# EAGLE design 4kfcn v1 (EAGLE 9.3.1)
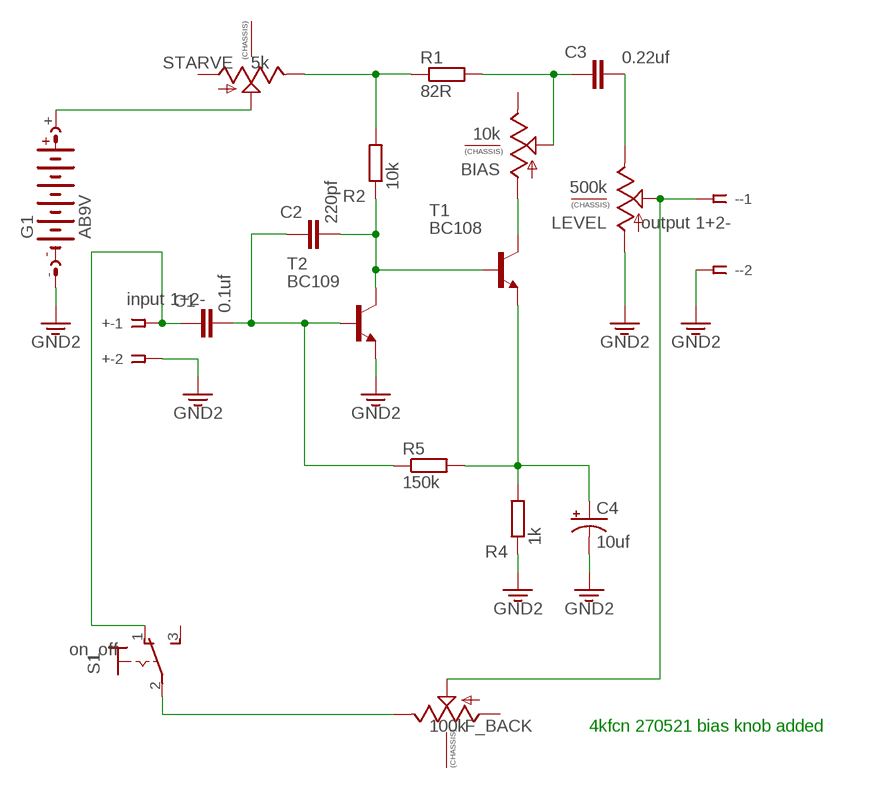
[diagram p0: schematic, sheet 1]

## Parts
+  input 1+2-  SSW-101-02-G-Q  [SSW-101-02-G-Q]
-  output 1+2-  SSW-101-02-G-Q  [SSW-101-02-G-Q]
BIAS  10k  9MM_SNAP-IN_POT_CHASSIS  [9MM_SNAP-IN_POT]
C1  0.1uf  C5/3.5  [C5B3.5]
C2  220pf  C5/3.5  [C5B3.5]
C3  0.22uf  C5/3.5  [C5B3.5]
C4  10uf  1000UF-RADIAL-5MM-25V-20%  [CPOL-RADIAL-5MM-10MM]
F_BACK  100k  9MM_SNAP-IN_POT_CHASSIS  [9MM_SNAP-IN_POT]
G1  AB9V  [AB9V]
LEVEL  500k  9MM_SNAP-IN_POT_CHASSIS  [9MM_SNAP-IN_POT]
R1  82R  R-EU_0207/10  [0207/10]
R2  10k  R-EU_0207/10  [0207/10]
R4  1k  R-EU_0207/10  [0207/10]
R5  150k  R-EU_0207/10  [0207/10]
S1  on_off  M9040P  [M9040P]
STARVE  5k  9MM_SNAP-IN_POT_CHASSIS  [9MM_SNAP-IN_POT]
T1  BC108  BC108B-NPN-TO18-EBC  [TO18]
T2  BC109  BC108B-NPN-TO18-EBC  [TO18]

## Nets
3.3V: +.2 -.2 C4.- G1.- LEVEL.1(A) R4.1 T2.1(E) ; supply symbol labelled GND2
N$1: C2.2 R2.1 T1.2(B) T2.3(C)
N$2: BIAS.1(A) T1.3(C)
N$3: C4.+ R4.2 R5.2 T1.1(E)
N$4: C1.2 C2.1 R5.1 T2.2(B)
N$5: BIAS.2(S) C3.1 R1.2
N$6: R1.1 R2.2 STARVE.3(E)
N$7: +.1 C1.1 S1.1(O)
N$8: C3.2 LEVEL.3(E)
N$9: -.1 F_BACK.2(S) LEVEL.2(S)
N$10: G1.+ STARVE.2(S)
N$11: F_BACK.3(E) S1.2(P)
Unconnected: BIAS.3(E) BIAS.CHASSIS1 BIAS.CHASSIS2 F_BACK.1(A) F_BACK.CHASSIS1 F_BACK.CHASSIS2 LEVEL.CHASSIS1 LEVEL.CHASSIS2 S1.3(S) STARVE.1(A) STARVE.CHASSIS1 STARVE.CHASSIS2

## Notes on the sheet
- 4kfcn 270521 bias knob added

## Library data of the parts
+ - = con-samtec:SSW-101-02-G: THROUGH-HOLE .025" SQ POST SOCKET Source: Samtec SSW.pdf; MF: Samtec Inc.; MPN: SSW-101-02-G-Q
BIAS F_BACK LEVEL STARVE = MusicThingModular:9MM_SNAP-IN_POT_CHASSIS: 9mm vertical snap-in pot, Alpha / Panasonic style, with a connection to the metal chassis for grounding
C1-C3 = capacitor-wima:C: CAPACITOR naming: grid - package width
C4 = SparkFun-Capacitors:1000UF: 1,000µF/1mF ceramic capacitors A capacitor is a passive two-terminal electrical component used to store electrical energy temporarily in an electric field. CAP-08070; PROD_ID: CAP-09538; VALUE: 1mF
G1 = battery:AB9V: 9-V BATTERY CLIP
R1 R2 R4 R5 = resistor:R-EU_: RESISTOR, European symbol
S1 = switch:M9040P: TOGGLE SWITCH Marquardt
T1 T2 = MusicThingModular:*-NPN-: NPN Transistror BF959 corrected 2008.03.06

## Board
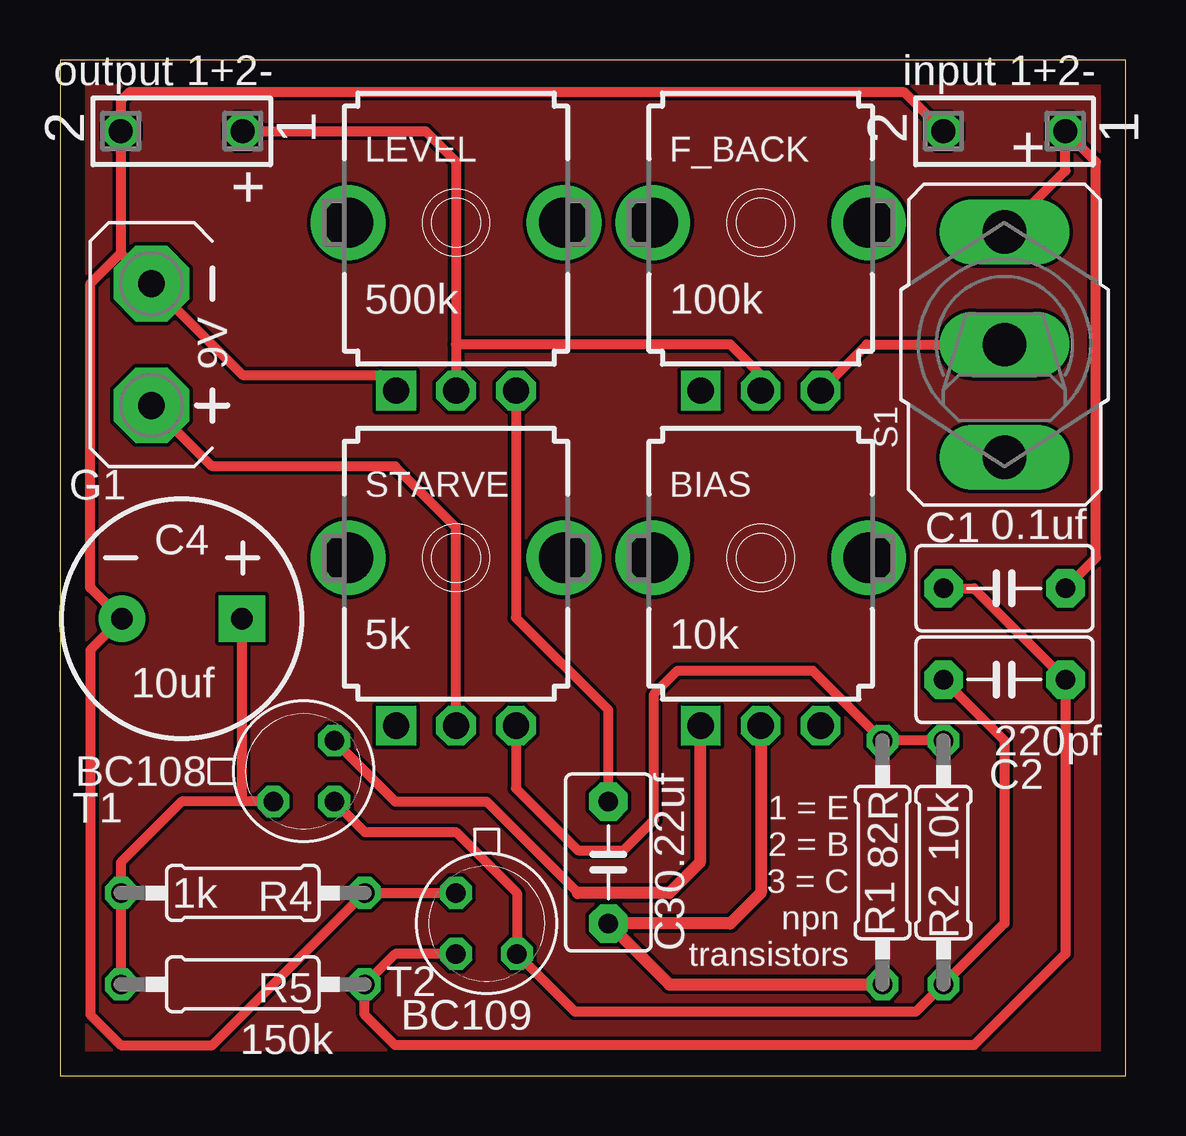
[diagram p1: board, top side]

Size 44.43 x 42.34 mm. Coordinates in mm from the lower left corner, seen from the top.
Outline: 0,0 44.43,0 44.43,42.34 0,42.34 0,0
Copper layers (1*16): Top 0.035mm / dielectric 1.5mm / Bottom 0.035mm
Design rules "default": minimum track width 6mil, minimum drill 0.35mm, track to track 6mil, track to pad 6mil, pad to pad 6mil, via to via 6mil, smd to smd 6mil, copper to edge 40mil, drill to drill 6mil, minimum pad ring 10mil, minimum via ring 8mil, stop-mask expansion 4mil, vias tented up to drill 0mil, thermal gap 10mil

### Footprints (pad centres in the part's own frame; a part is rotated, then mirrored left to right if it is on the bottom)
SSW-101-02-G-Q = drill 1 pad 1.5 octagon: 1 0,-2.54; 2 0,2.54
9MM_SNAP-IN_POT = drill 1.1 square: 1 -2.5,-7 | drill 1.1 octagon: 2 0,-7; 3 2.5,-7 | drill 2.1 pad 2.794: CHASSIS1 -4.5,0; CHASSIS2 4.5,0
C5B3.5 = drill 0.813 pad 1.6 octagon: 1 -2.54,0; 2 2.54,0
CPOL-RADIAL-5MM-10MM = drill 0.9 pad 1.93 square: + 2.5,0 | drill 0.9 pad 1.93: - -2.5,0
AB9V = drill 1.118 pad 3.15 octagon: + 0,2.54; - 0,-2.54
0207/10 = drill 0.813 octagon: 1 -5.08,0; 2 5.08,0
M9040P = drill 1.803 long: 1 0,4.699; 2 0,0; 3 0,-4.699
TO18 = drill 0.813 octagon: 1 -1.27,-1.27; 2 1.27,-1.27; 3 1.27,1.27

### Placement (x,y rotation side)
+  39.37,39.37 90 top
-  5.08,39.37 90 top
BIAS  29.21,21.59 0 top
C1  39.37,20.32 180 top
C2  39.37,16.51 180 top
C3  22.86,8.89 90 top
C4  5.08,19.05 0 top
F_BACK  29.21,35.56 0 top
G1  3.81,30.48 180 top
LEVEL  16.51,35.56 0 top
R1  34.29,8.89 270 top
R2  36.83,8.89 90 top
R4  7.62,7.62 180 top
R5  7.62,3.81 180 top
S1  39.37,30.48 0 top
STARVE  16.51,21.59 0 top
T1  10.16,12.7 0 top
T2  17.78,6.35 270 top

### Tracks (layer width: path | path; a pad name or v marks a point on that pad's centre or on a via)
3.3V
  Top 0.406: T2.1 R4.1 6.35,1.27 2.54,1.27 1.27,2.54 1.27,17.74 C4.- 1.31,20.32 1.27,20.32 1.27,33.02 2.54,34.29 | 2.54,34.29 -.2 2.54,40.64 2.9,41 35.2,41 +.2 | 2.54,34.29 G1.- 7.62,29.21 13.36,29.21 LEVEL.1
N$1
  Top 0.406: C2.2 39.37,13.97 39.37,6.35 R2.1 35.69,2.67 21.46,2.67 T2.3 19.05,7.62 16.51,10.16 12.7,10.16 T1.2
N$2
  Top 0.406: 21.59,7.62 17.78,11.43 13.97,11.43 T1.3
  Top 0.508: BIAS.1 26.67,14.55 26.67,8.89 25.4,7.62 21.59,7.62
N$3
  Top 0.406: C4.+ 7.58,11.43 T1.1 5.08,11.43 2.54,8.89 R4.2 R5.2
N$4
  Top 0.406: T2.2 13.97,5.08 R5.1 12.7,2.54 13.97,1.27 38.1,1.27 41.91,5.08 C2.1 38.1,20.32 C1.2
N$5
  Top 0.508: R1.2 25.4,3.81 C3.1 27.94,6.35 29.21,7.62 BIAS.2
N$6
  Top 0.406: R2.2 R1.1 31.37,16.89 25.74,16.89 24.77,15.91 24.77,10.67 23.5,9.4 21.59,9.4 19.01,11.98 STARVE.3
N$7
  Top 0.406: C1.1 43.18,21.59 43.18,38.1 +.1 41.91,37.72 S1.1
N$8
  Top 0.406: C3.2 22.86,15.24 19.01,19.09 LEVEL.3
N$9
  Top 0.406: -.1 15.24,39.37 16.51,38.1 16.51,30.48 | 16.51,30.48 LEVEL.2 | F_BACK.2 29.21,29.21 27.94,30.48 16.51,30.48
N$10
  Top 0.406: STARVE.2 16.51,22.86 13.97,25.4 6.35,25.4 G1.+
N$11
  Top 0.406: F_BACK.3 33.63,30.48 S1.2
TOP
  pour Top: 0,0 0,42.42 44.45,42.42 44.45,0

### Text on the board
tNames: + | + | 1 = E / 2 = B / 3 = C / npn / transistors
tValues: BJC - 4KFCN_v1